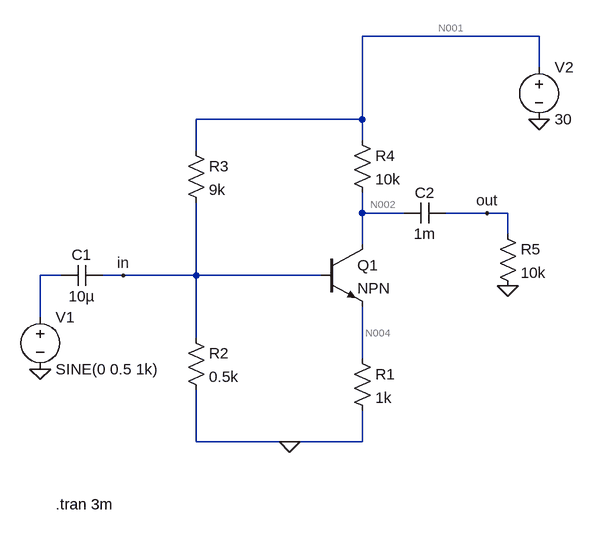
[diagram p0: schematic Draft3.asc]
Draft3.asc, the LTspice schematic file:
Version 4.1
SHEET 1 880 680
WIRE 432 -208 160 -208
WIRE 432 -160 432 -208
WIRE 160 -80 160 -208
WIRE 160 -80 -96 -80
WIRE 160 -48 160 -80
WIRE -96 -32 -96 -80
WIRE 160 64 160 32
WIRE 224 64 160 64
WIRE 352 64 288 64
WIRE 384 64 352 64
WIRE 384 96 384 64
WIRE 160 112 160 64
WIRE -304 160 -336 160
WIRE -208 160 -240 160
WIRE -96 160 -96 48
WIRE -96 160 -208 160
WIRE 96 160 -96 160
WIRE -336 224 -336 160
WIRE -96 256 -96 160
WIRE 160 288 160 208
WIRE -96 416 -96 336
WIRE 48 416 -96 416
WIRE 160 416 160 368
WIRE 160 416 48 416
FLAG -336 304 0
FLAG 48 416 0
FLAG 432 -80 0
FLAG 352 64 out
FLAG -208 160 in
FLAG 384 176 0
SYMBOL npn 96 112 R0
SYMATTR InstName Q1
SYMBOL res 144 272 R0
SYMATTR InstName R1
SYMATTR Value 1k
SYMBOL res -112 240 R0
SYMATTR InstName R2
SYMATTR Value 0.5k
SYMBOL res -112 -48 R0
SYMATTR InstName R3
SYMATTR Value 9k
SYMBOL res 144 -64 R0
SYMATTR InstName R4
SYMATTR Value 10k
SYMBOL voltage -336 208 R0
WINDOW 123 0 0 Left 0
WINDOW 39 0 0 Left 0
SYMATTR InstName V1
SYMATTR Value SINE(0 0.5 1k)
SYMBOL voltage 432 -176 R0
SYMATTR InstName V2
SYMATTR Value 30
SYMBOL cap -240 144 R90
WINDOW 0 0 32 VBottom 2
WINDOW 3 32 32 VTop 2
SYMATTR InstName C1
SYMATTR Value 10µ
SYMBOL cap 288 48 R90
WINDOW 0 0 32 VBottom 2
WINDOW 3 32 32 VTop 2
SYMATTR InstName C2
SYMATTR Value 1m
SYMBOL res 368 80 R0
SYMATTR InstName R5
SYMATTR Value 10k
TEXT -312 512 Left 2 !.tran 3m

The netlist it stands for:
* Draft3.asc
Q1 N002 in N004 0 NPN
R1 N004 0 1k
R2 in 0 0.5k
R3 N001 in 9k
R4 N001 N002 10k
V1 N003 0 SINE(0 0.5 1k)
V2 N001 0 30
C1 in N003 10µ
C2 out N002 1m
R5 out 0 10k
.model NPN NPN
.model PNP PNP
.lib standard.bjt
.tran 3m
.backanno
.end

* Results of the author's LTspice run, read from the files saved beside the schematic
* Operating Point, zero values left out:
*   V(in) = 1.575 V
*   V(n001) = 30 V
*   V(n002) = 22.01 V
*   V(n004) = 806.7 mV
*   I(R1) = 806.7 µA
*   I(R2) = 3.15 mA
*   I(R3) = 3.158 mA
*   I(R4) = 798.8 µA
*   I(V2) = -3.957 mA
*   Ib(Q1) = 7.988 µA
*   Ic(Q1) = 798.8 µA
*   Ie(Q1) = -806.7 µA
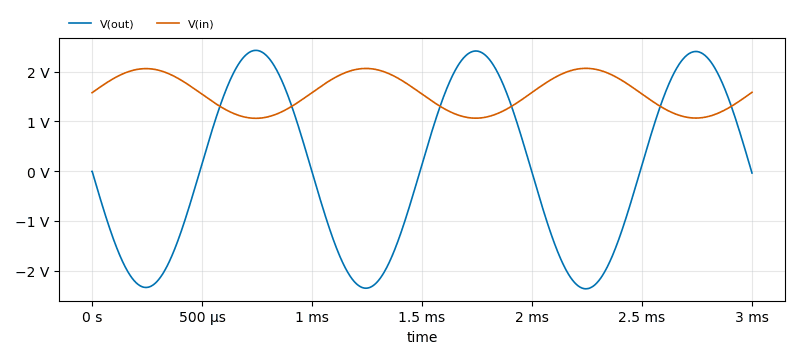
[diagram p1: Transient Analysis of Draft3.asc, plotted from the saved traces]
* Transient Analysis, 1 run:
*   V(out): min -2.362 V, max 2.425 V, average 46.63 mV, rms 1.686 V, last -38.04 mV
*   V(in): min 1.061 V, max 2.064 V, average 1.563 V, rms 1.602 V, last 1.583 V